# Altium schematic sheet sheet_template.SchDoc
size A3; DocumentDate: 4/22/2024
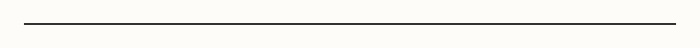
[diagram p0: sheet_template.SchDoc]